# Altium schematic sheet Power_Supply_USB.SchDoc
size A4; SheetNumber: 5; SheetTotal: 5
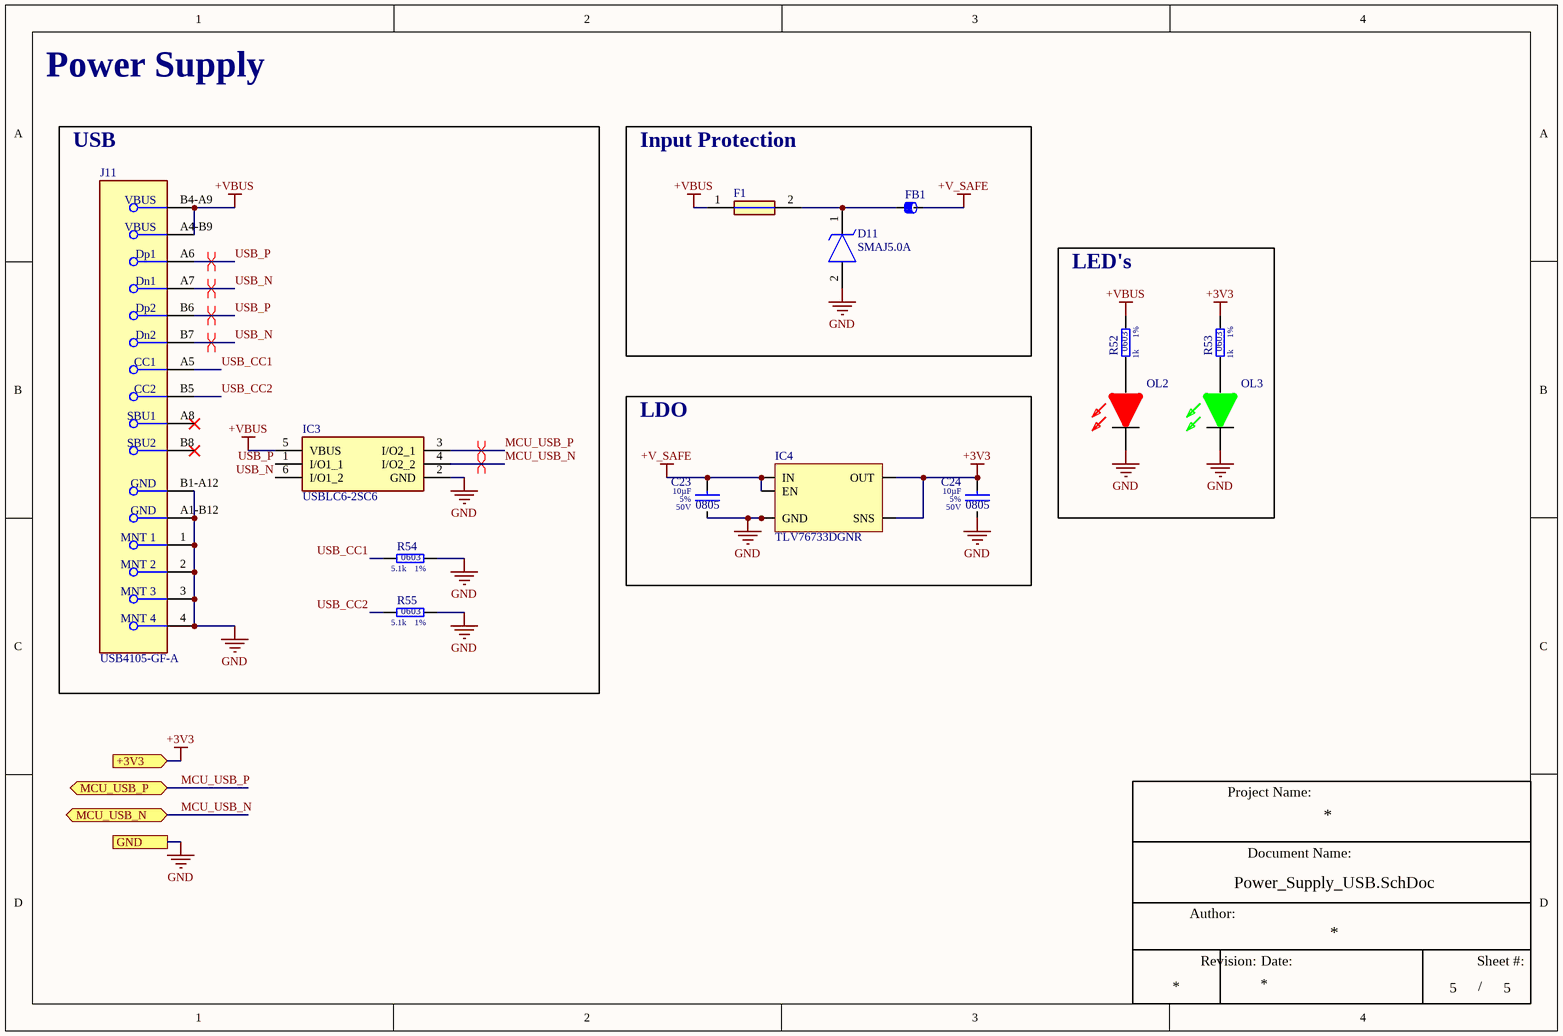
[diagram p0: Power_Supply_USB.SchDoc]

## Parts
C23  value 10µF  Tolerance: 5%  Voltage Rating: 50V  Case/Package: 0805  [0805_Capacitor]  (hidden comment: C_10u_50V_0805_10)
C24  value 10µF  Tolerance: 5%  Voltage Rating: 50V  Case/Package: 0805  [0805_Capacitor]  (hidden comment: C_10u_50V_0805_10)
D11  SMAJ5.0A  [DIOM5226X243N]
F1  1206L050_15YR  [FUSC3216X75N]  (value not drawn)
FB1  MPZ1608S601ATA00  [BEADC1608X75N]  (value not drawn)
IC3  USBLC6-2SC6  [SOT95P280X145-6N]
IC4  TLV76733DGNR  [SOP65P490X110-9N]
J11  USB4105-GF-A  [USB_C]
OL2  SML-LX0603SIW-TR  [LEDC1608X60N]  (value not drawn)
OL3  SML-LX0603GW-TR  [LEDC1608X60N]  (value not drawn)
R52  Tolerance: 1%  Resistance: 1k  Case/Package: 0603  [0603_Resistor]  (hidden comment: R_1k_0603_1)
R53  Tolerance: 1%  Resistance: 1k  Case/Package: 0603  [0603_Resistor]  (hidden comment: R_1k_0603_1)
R54  Tolerance: 1%  Resistance: 5.1k  Case/Package: 0603  [0603_Resistor]  (hidden comment: R_5k1_0603_5)
R55  Tolerance: 1%  Resistance: 5.1k  Case/Package: 0603  [0603_Resistor]  (hidden comment: R_5k1_0603_5)

## Blocks framed on the sheet
USB: IC3 J11 R54 R55
Input Protection: D11 F1 FB1
LED's: OL2 OL3 R52 R53
LDO: C23 C24 IC4

## Ports
+3V3 (in), GND, MCU_USB_N (bidir), MCU_USB_P (bidir)

## Nets
+3V3: C24.1 IC4.1(OUT) IC4.2(SNS) R53.2 ; port +3V3
+V_SAFE: C23.1 FB1.2 IC4.5(EN) IC4.8(IN)
+VBUS: F1.1 IC3.5(VBUS) J11.A4-B9(VBUS) J11.B4-A9(VBUS) R52.2
GND: C23.2 C24.2 D11.2(A) IC3.2(GND) IC4.4(GND_2) IC4.6(GND) IC4.9(EP) J11.1(MNT_1) J11.2(MNT_2) J11.3(MNT_3) J11.4(MNT_4) J11.A1-B12(GND) J11.B1-A12(GND) OL2.1(K) OL3.1(K) R54.2 R55.2 ; port GND
MCU_USB_N: IC3.4(I/O2_2) ; port MCU_USB_N
MCU_USB_P: IC3.3(I/O2_1) ; port MCU_USB_P
USB_CC1: J11.A5(CC1) R54.1
USB_CC2: J11.B5(CC2) R55.1
USB_N: IC3.6(I/O1_2) J11.A7(Dn1) J11.B7(Dn2)
USB_P: IC3.1(I/O1_1) J11.A6(Dp1) J11.B6(Dp2)
NetD11_1: D11.1(K) F1.2 FB1.1
NetOL2_2: OL2.2(A) R52.1
NetOL3_2: OL3.2(A) R53.1

Not connected (* = marked no-connect by the designer): J11 A8(SBU1)* B8(SBU2)*

## Layout directives
differential pair: MCU_USB_N, MCU_USB_P, USB_N, USB_P

## Notes on the sheet
- Power Supply
- Project Name:
- Author:
- Document Name:
- Revision:
- Date:
- Sheet #:
- /

## Library data of the parts
C23 C24 = CMP-001-00003-17: Man. Part Num.: GRM21BR61H106KE43L; Revision Num.: 1; Capacitor Type: Ceramic; HelpURL: https://www.mouser.pl/datasheet/2/281/1/GRM21BR61H106KE43_01A-1986884.pdf; Mounting Technology: SMT
D11 = SMAJ5.0A: TVS Diode (Uni-directional); Manufacturer_Name: Kyocera AVX; Datasheet Link: http://datasheets.kyocera-avx.com/tvsdiodes.pdf; Height: 2.43mm; Manufacturer_Part_Number: SMAJ5.0A; Mouser Part Number: 581-SMAJ5.0A; Mouser Price/Stock: https://www.mouser.co.uk/ProductDetail/KYOCERA-AVX/SMAJ5.0A?qs=tuYJFV7zqWuCnk6fJgfdVg%3D%3D; Arrow Part Number: SMAJ5.0A; Arrow Price/Stock: null?region=nac
F1 = 1206L050_15YR: Fuse; Manufacturer_Name: Wickmann; Manufacturer_Part_Number: 1206L050/15YR; Datasheet Link: https://docs.rs-online.com/8c7c/0900766b81637964.pdf; Height: 0.75mm
FB1 = MPZ1608S601ATA00: Ferrite Bead; Manufacturer_Name: TDK; Datasheet Link: https://product.tdk.com/system/files/dam/doc/product/emc/emc/beads/catalog/beads_commercial_power_mpz1608_en.pdf; Height: 0.75mm; Manufacturer_Part_Number: MPZ1608S601ATA00; Mouser Part Number: 810-MPZ1608S601ATA00; Mouser Price/Stock: https://www.mouser.co.uk/ProductDetail/TDK/MPZ1608S601ATA00?qs=47dIwT2ZIzth0CTKDYh9rw%3D%3D; Arrow Part Number: MPZ1608S601ATA00; Arrow Price/Stock: https://www.arrow.com/en/products/mpz1608s601ata00/tdk.html?utm_currency=USD&region=europe
IC3 = USBLC6-2SC6: Integrated Circuit; Manufacturer_Name: STMicroelectronics; Datasheet Link: https://www.st.com/resource/en/datasheet/usblc6-2.pdf; Height: 1.45mm; Manufacturer_Part_Number: USBLC6-2SC6; Mouser Part Number: 511-USBLC6-2SC6; Mouser Price/Stock: https://www.mouser.co.uk/ProductDetail/STMicroelectronics/USBLC6-2SC6?qs=po45yt2pPpu%2FhNIlwQdTlg%3D%3D; Arrow Part Number: USBLC6-2SC6; Arrow Price/Stock: https://www.arrow.com/en/products/usblc6-2sc6/stmicroelectronics?utm_currency=USD&region=europe
IC4 = TLV76733DGNR: Integrated Circuit; Manufacturer_Name: Texas Instruments; Datasheet Link: https://www.ti.com/lit/ds/symlink/tlv767.pdf?ts=1601893180135&ref_url=https%253A%252F%252Fduckduckgo.com%252F; Height: 1.1mm; Manufacturer_Part_Number: TLV76733DGNR; Mouser Part Number: 595-TLV76733DGNR; Mouser Price/Stock: https://www.mouser.co.uk/ProductDetail/Texas-Instruments/TLV76733DGNR?qs=W%2FMpXkg%252BdQ7WCurh%2FfEdlw%3D%3D; Arrow Part Number: TLV76733DGNR; Arrow Price/Stock: https://www.arrow.com/en/products/tlv76733dgnr/texas-instruments?utm_currency=USD&region=nac
J11 = USB_C: USB Connector Type-C, 16 Contact(s), Female, Right Angle, SMT, USB 2.0
OL2 = SML-LX0603SIW-TR: LED; Manufacturer_Name: Lumex; Datasheet Link: https://www.lumex.com/led-smd-0603.html; Height: 0.6mm; Manufacturer_Part_Number: SML-LX0603SIW-TR; Mouser Part Number: 696-SML-LX0603SIW; Mouser Price/Stock: https://www.mouser.co.uk/ProductDetail/Lumex/SML-LX0603SIW-TR?qs=lPH1AmYLb0ytkrMTawxMgQ%3D%3D; Arrow Part Number: SML-LX0603SIW-TR; Arrow Price/Stock: https://www.arrow.com/en/products/sml-lx0603siw-tr/lumex?utm_currency=USD&region=nac
OL3 = SML-LX0603GW-TR: LED; Manufacturer_Name: Lumex; Datasheet Link: https://www.lumex.com/datasheet/SML-LX0603GW-TR; Height: 0.727mm; Manufacturer_Part_Number: SML-LX0603GW-TR; Mouser Part Number: N/A; Mouser Price/Stock: https://www.mouser.com/Search/Refine.aspx?Keyword=N%2FA; Arrow Part Number: SML-LX0603GW-TR; Arrow Price/Stock: https://www.arrow.com/en/products/sml-lx0603gw-tr/lumex?utm_currency=USD&region=nac
R52 R53 = CMP-009-00099-4: Revision Num.: 1; Voltage Rating: 75V; Power: 100mW; HelpURL: https://www.tme.eu/Document/622e28308c06d160637f2b14751ba16b/Data%20Sheet%20CRCW_BCe3.pdf; Mounting Technology: SMT
R54 R55 = CMP-009-00017-19: Revision Num.: 1; Power: 100mW; Voltage Rating: 50V; HelpURL: https://www.mouser.pl/datasheet/2/54/cr-1858361.pdf; Mounting Technology: SMT